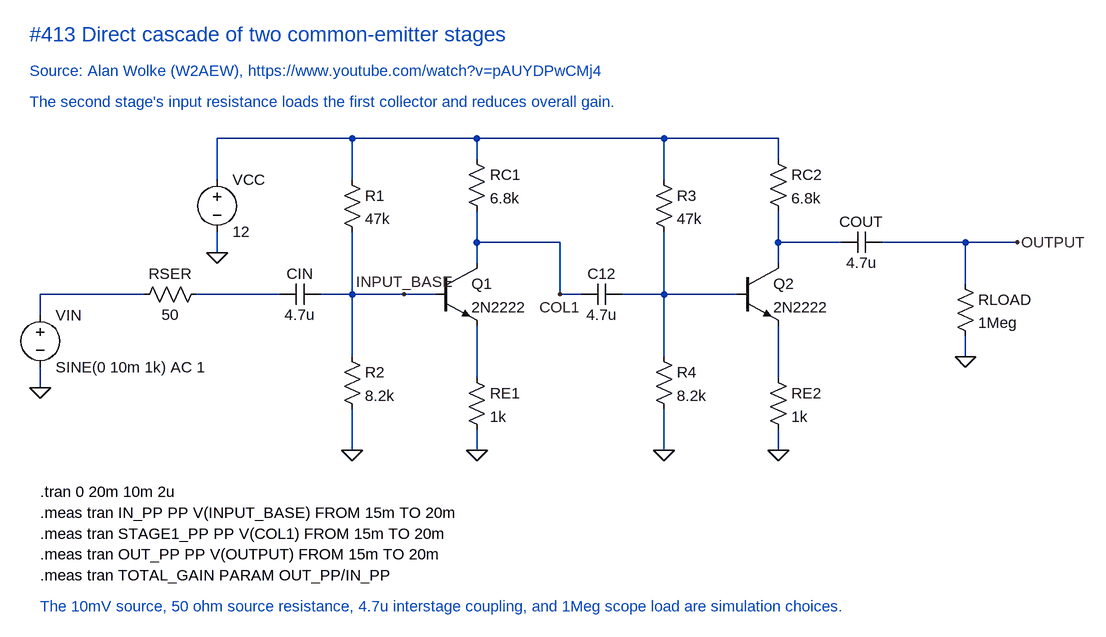
[diagram p0: schematic Direct common-emitter cascade.asc]
Direct common-emitter cascade.asc, the LTspice schematic file:
Version 4.1
SHEET 1 1500 850
WIRE 160 -128 -48 -128
WIRE 352 -128 160 -128
WIRE 640 -128 352 -128
WIRE 816 -128 640 -128
WIRE 640 -64 640 -128
WIRE 816 -96 816 -128
WIRE -48 -64 -48 -128
WIRE 160 -64 160 -128
WIRE 352 -96 352 -128
WIRE 352 32 352 -16
WIRE 480 32 352 32
WIRE 480 112 480 32
WIRE 512 112 480 112
WIRE -48 48 -48 16
WIRE 352 64 352 32
WIRE -320 112 -320 144
WIRE -160 112 -320 112
WIRE 48 112 -80 112
WIRE 160 112 112 112
WIRE 160 112 160 16
WIRE 240 112 160 112
WIRE 288 112 240 112
WIRE 160 208 160 112
WIRE 352 240 352 160
WIRE -320 256 -320 224
WIRE 160 352 160 288
WIRE 352 352 352 320
WIRE 640 112 576 112
WIRE 640 112 640 16
WIRE 640 208 640 112
WIRE 752 112 640 112
WIRE 640 352 640 288
WIRE 816 32 816 -16
WIRE 816 64 816 32
WIRE 816 240 816 160
WIRE 816 352 816 320
WIRE 912 32 816 32
WIRE 1104 32 976 32
WIRE 1184 32 1104 32
WIRE 1104 96 1104 32
WIRE 1104 208 1104 176
FLAG -48 48 0
FLAG -320 256 0
FLAG 160 352 0
FLAG 352 352 0
FLAG 640 352 0
FLAG 816 352 0
FLAG 1104 208 0
FLAG 240 112 INPUT_BASE
FLAG 480 112 COL1
FLAG 1184 32 OUTPUT
SYMBOL voltage -48 -80 R0
SYMATTR InstName VCC
SYMATTR Value 12
SYMBOL voltage -320 128 R0
SYMATTR InstName VIN
SYMATTR Value SINE(0 10m 1k) AC 1
SYMBOL res -64 96 R90
WINDOW 0 0 56 VBottom 2
WINDOW 3 32 56 VTop 2
SYMATTR InstName RSER
SYMATTR Value 50
SYMBOL cap 112 96 R90
WINDOW 0 0 32 VBottom 2
WINDOW 3 32 32 VTop 2
SYMATTR InstName CIN
SYMATTR Value 4.7u
SYMBOL res 144 -80 R0
SYMATTR InstName R1
SYMATTR Value 47k
SYMBOL res 144 192 R0
SYMATTR InstName R2
SYMATTR Value 8.2k
SYMBOL res 336 -112 R0
SYMATTR InstName RC1
SYMATTR Value 6.8k
SYMBOL npn 288 64 R0
SYMATTR InstName Q1
SYMATTR Value 2N2222
SYMBOL res 336 224 R0
SYMATTR InstName RE1
SYMATTR Value 1k
SYMBOL cap 576 96 R90
WINDOW 0 0 32 VBottom 2
WINDOW 3 32 32 VTop 2
SYMATTR InstName C12
SYMATTR Value 4.7u
SYMBOL res 624 -80 R0
SYMATTR InstName R3
SYMATTR Value 47k
SYMBOL res 624 192 R0
SYMATTR InstName R4
SYMATTR Value 8.2k
SYMBOL res 800 -112 R0
SYMATTR InstName RC2
SYMATTR Value 6.8k
SYMBOL npn 752 64 R0
SYMATTR InstName Q2
SYMATTR Value 2N2222
SYMBOL res 800 224 R0
SYMATTR InstName RE2
SYMATTR Value 1k
SYMBOL cap 976 16 R90
WINDOW 0 0 32 VBottom 2
WINDOW 3 32 32 VTop 2
SYMATTR InstName COUT
SYMATTR Value 4.7u
SYMBOL res 1088 80 R0
SYMATTR InstName RLOAD
SYMATTR Value 1Meg
TEXT -336 -288 Left 3 ;#413 Direct cascade of two common-emitter stages
TEXT -336 -232 Left 2 ;Source: Alan Wolke (W2AEW), https://www.youtube.com/watch?v=pAUYDPwCMj4
TEXT -336 -184 Left 2 ;The second stage's input resistance loads the first collector and reduces overall gain.
TEXT -320 416 Left 2 !.tran 0 20m 10m 2u
TEXT -320 448 Left 2 !.meas tran IN_PP PP V(INPUT_BASE) FROM 15m TO 20m
TEXT -320 480 Left 2 !.meas tran STAGE1_PP PP V(COL1) FROM 15m TO 20m
TEXT -320 512 Left 2 !.meas tran OUT_PP PP V(OUTPUT) FROM 15m TO 20m
TEXT -320 544 Left 2 !.meas tran TOTAL_GAIN PARAM OUT_PP/IN_PP
TEXT -320 592 Left 2 ;The 10mV source, 50 ohm source resistance, 4.7u interstage coupling, and 1Meg scope load are simulation choices.

The netlist it stands for:
* Direct common-emitter cascade.asc
VCC N001 0 12
VIN N002 0 SINE(0 10m 1k) AC 1
RSER N003 N002 50
CIN INPUT_BASE N003 4.7u
R1 N001 INPUT_BASE 47k
R2 INPUT_BASE 0 8.2k
RC1 N001 COL1 6.8k
Q1 COL1 INPUT_BASE N004 0 2N2222
RE1 N004 0 1k
C12 N005 COL1 4.7u
R3 N001 N005 47k
R4 N005 0 8.2k
RC2 N001 N006 6.8k
Q2 N006 N005 N007 0 2N2222
RE2 N007 0 1k
COUT OUTPUT N006 4.7u
RLOAD OUTPUT 0 1Meg
.model NPN NPN
.model PNP PNP
.lib standard.bjt
* #413 Direct cascade of two common-emitter stages
* Source: Alan Wolke (W2AEW), https://www.youtube.com/watch?v=pAUYDPwCMj4
* The second stage's input resistance loads the first collector and reduces overall gain.
.tran 0 20m 10m 2u
.meas tran IN_PP PP V(INPUT_BASE) FROM 15m TO 20m
.meas tran STAGE1_PP PP V(COL1) FROM 15m TO 20m
.meas tran OUT_PP PP V(OUTPUT) FROM 15m TO 20m
.meas tran TOTAL_GAIN PARAM OUT_PP/IN_PP
* The 10mV source, 50 ohm source resistance, 4.7u interstage coupling, and 1Meg scope load are simulation choices.
.backanno
.end